# Altium project Charger-Board-v1.1.PrjPcb (part 1 of 3)
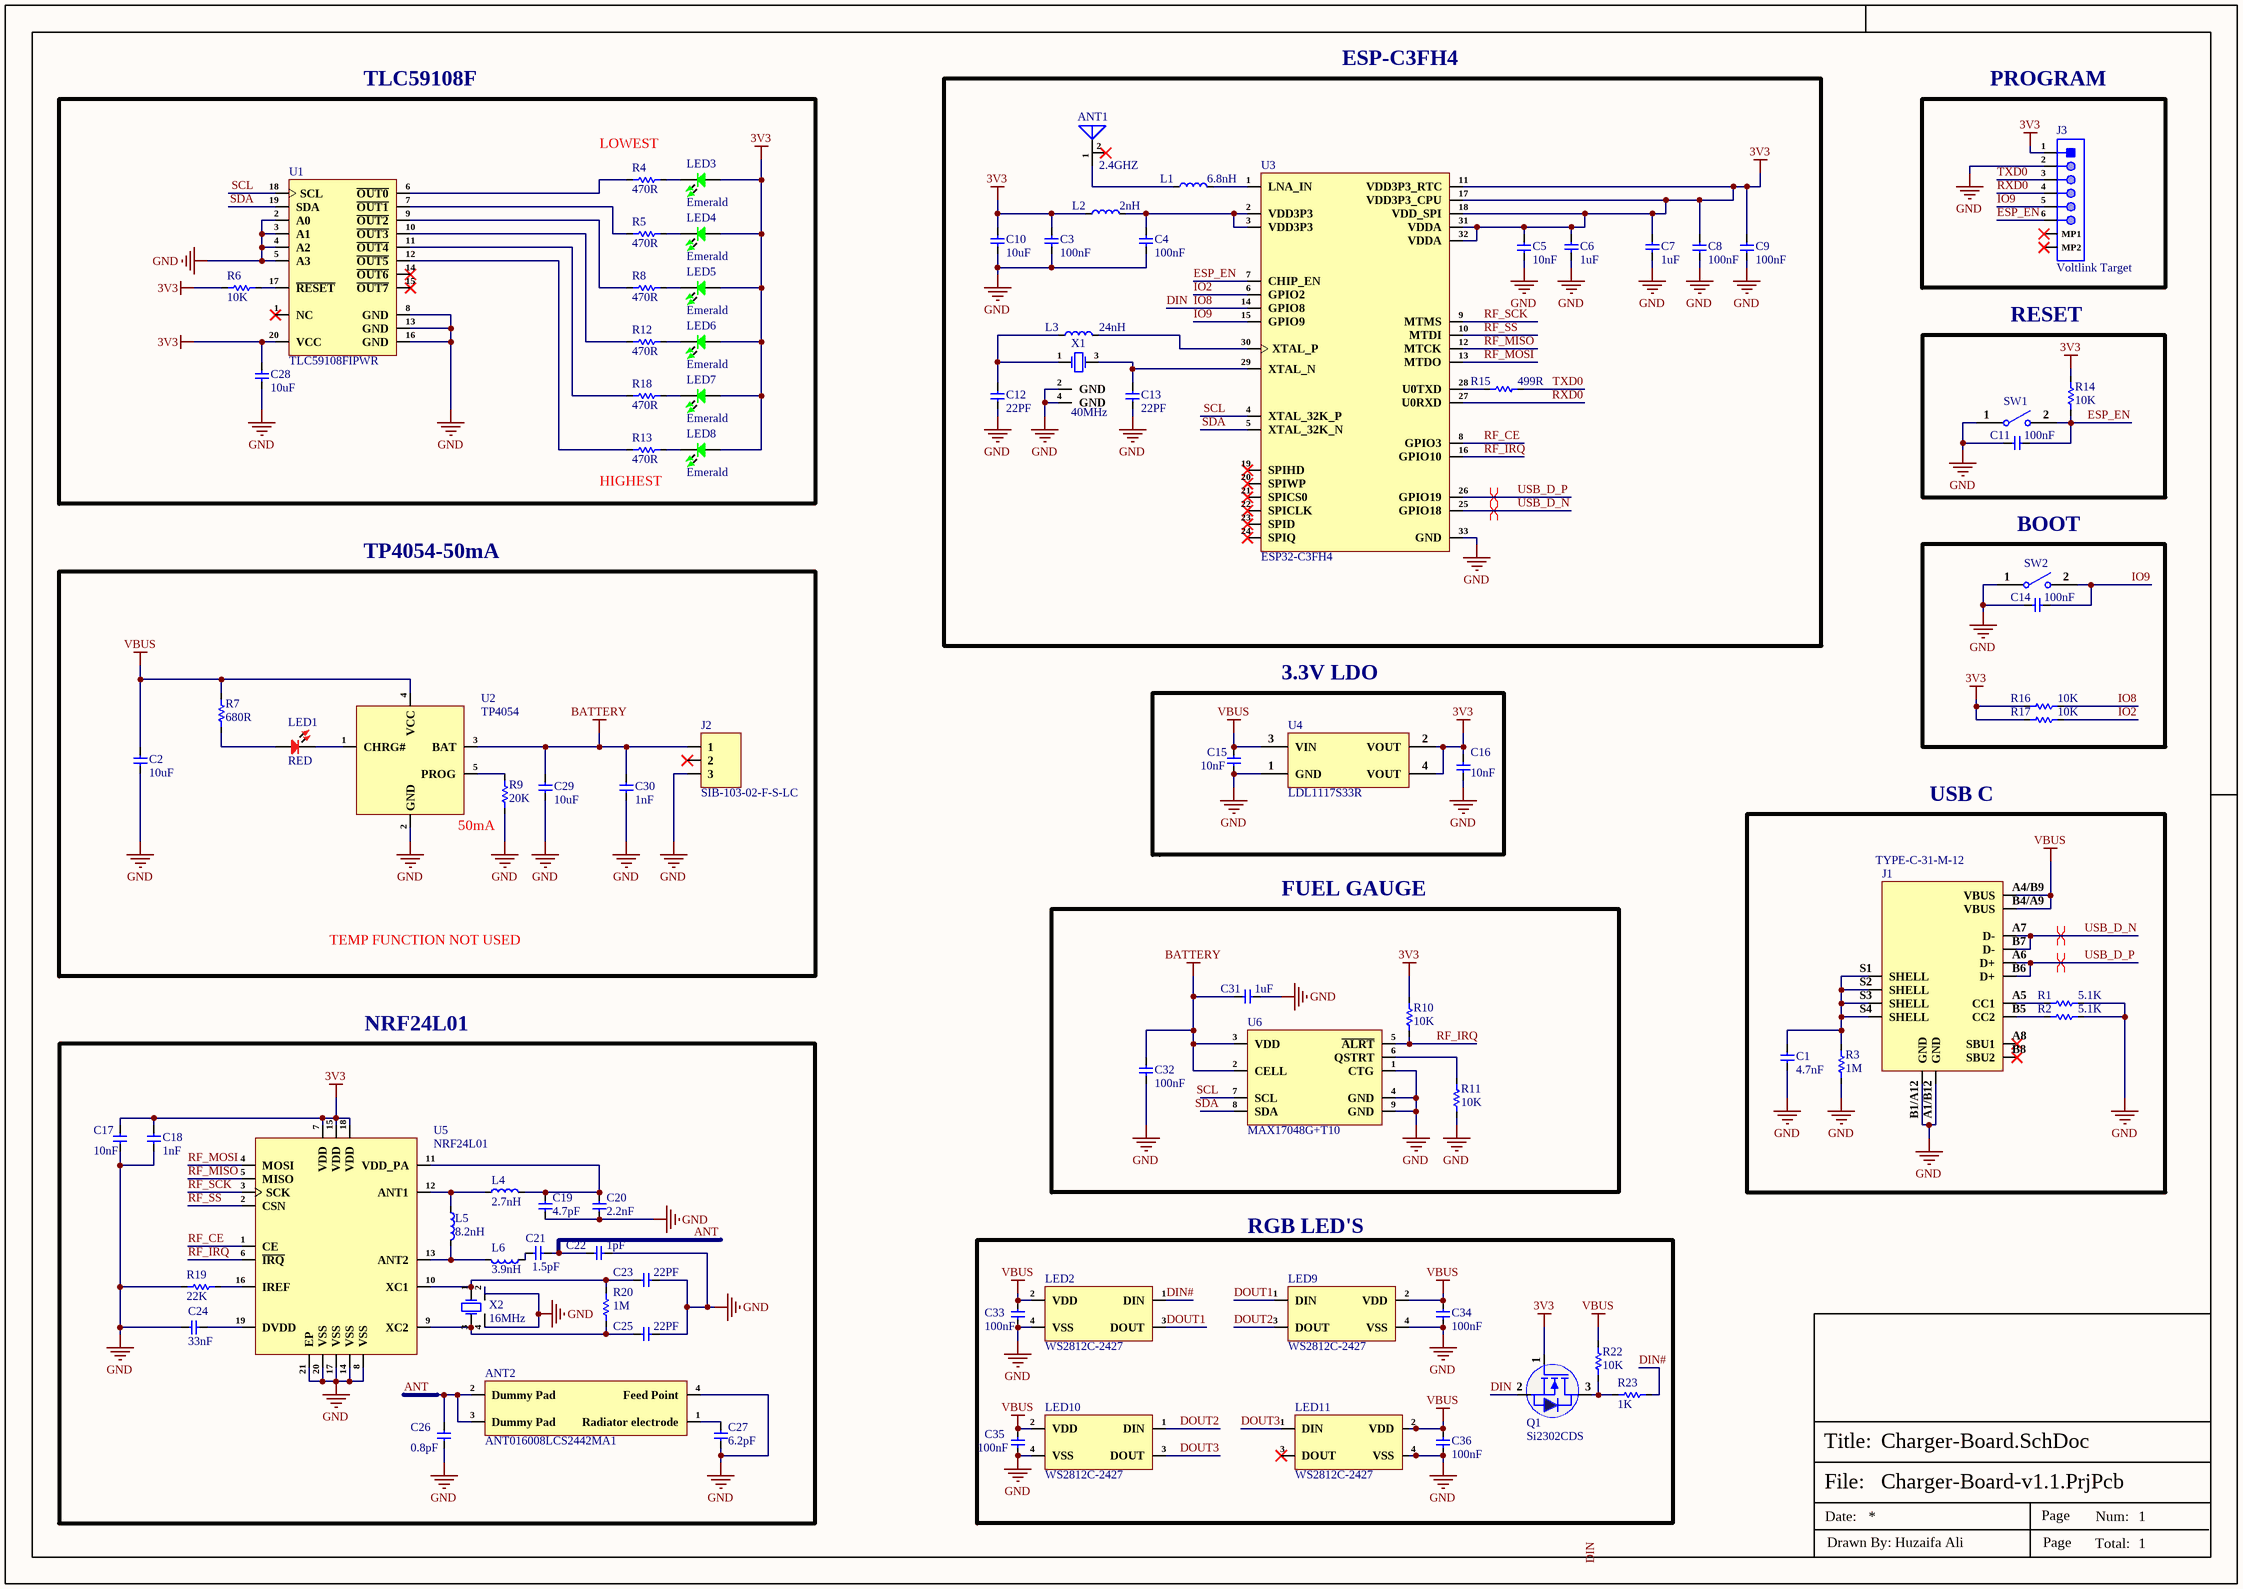
[diagram p0: Charger-Board.SchDoc]
1 sheet, 91 parts. Net scope: global (net labels, ports and power ports of the same name join across sheets).
Board file: Charger-v1.1.PcbDoc

## Sheet Charger-Board.SchDoc
size 420 x 297 mm; SheetNumber: 1; SheetTotal: 1

### Parts
ANT1  2.4GHZ  [RFANT3216120A5T]
ANT2  ANT016008LCS2442MA1  [ANT016008LCS2442MA1]
C1  4.7nF  [Cap-1206]
C2  10uF  [Cap-0603]
C3  100nF  [Cap-0402]
C4  100nF  [Cap-0402]
C5  10nF  [Cap-0402]
C6  1uF  [Cap-0402]
C7  1uF  [Cap-0402]
C8  100nF  [Cap-0402]
C9  100nF  [Cap-0402]
C10  10uF  [Cap-0402]
C11  100nF  [Cap-0402]
C12  22PF  [Cap-0402]
C13  22PF  [Cap-0402]
C14  100nF  [Cap-0402]
C15  10nF  [Cap-0402]
C16  10nF  [Cap-0402]
C17  10nF  [Cap-0402]
C18  1nF  [Cap-0402]
C19  4.7pF  [Cap-0402]
C20  2.2nF  [Cap-0402]
C21  1.5pF  [Cap-0402]
C22  1pF  [Cap-0402]
C23  22PF  [Cap-0402]
C24  33nF  [CAP-0201]
C25  22PF  [Cap-0402]
C26  0.8pF  [CAP-0201]
C27  6.2pF  [CAP-0201]
C28  10uF  [Cap-0603]
C29  10uF  [Cap-0603]
C30  1nF  [Cap-0402]
C31  1uF  [Cap-0402]
C32  100nF  [Cap-0402]
C33  100nF  [Cap-0402]
C34  100nF  [Cap-0402]
C35  100nF  [Cap-0402]
C36  100nF  [Cap-0402]
J1  TYPE-C-31-M-12  [TYPE-C-31-M-12_]
J2  SIB-103-02-F-S-LC  [SIB-103-02-F-S-LC]
J3  Voltlink Target  [Voltlink Target]
L1  6.8nH  [IND-0201]
L2  2nH  [IND-0201]
L3  24nH  [IND-0201]
L4  2.7nH  [IND-0402]
L5  8.2nH  [IND-0402]
L6  3.9nH  [IND-0402]
LED1  RED  [LED-0603]
LED2  WS2812C-2427  [WS2812C-2427]
LED3  Emerald  [LED-0603]
LED4  Emerald  [LED-0603]
LED5  Emerald  [LED-0603]
LED6  Emerald  [LED-0603]
LED7  Emerald  [LED-0603]
LED8  Emerald  [LED-0603]
LED9  WS2812C-2427  [WS2812C-2427]
LED10  WS2812C-2427  [WS2812C-2427]
LED11  WS2812C-2427  [WS2812C-2427]
Q1  Si2302CDS  [Sot-23]
R1  5.1K  [Res-0402]
R2  5.1K  [Res-0402]
R3  1M  [Res-0603]
R4  470R  [Res-0402]
R5  470R  [Res-0402]
R6  10K  [Res-0402]
R7  680R  [Res-0402]
R8  470R  [Res-0402]
R9  20K  [Res-0402]
R10  10K  [Res-0402]
R11  10K  [Res-0402]
R12  470R  [Res-0402]
R13  470R  [Res-0402]
R14  10K  [Res-0402]
R15  499R  [Res-0402]
R16  10K  [Res-0402]
R17  10K  [Res-0402]
R18  470R  [Res-0402]
R19  22K  [Res-0603]
R20  1M  [Res-0402]
R22  10K  [Res-0402]
R23  1K  [Res-0402]
SW1  B3U-1000P  [B3U-1000P]  (value not drawn)
SW2  B3U-1000P  [B3U-1000P]  (value not drawn)
U1  TLC59108FIPWR  [TSSOP-20]
U2  TP4054  [SOT-23-5]
U3  ESP32-C3FH4  [32-QFN (5x5)]
U4  LDL1117S33R  [SOT- 223]
U5  NRF24L01  [20-QFN (4x4) EP Via]
U6  MAX17048G+T10  [8-TDFN-EP (2x2)]
X1  40MHz  [X322540MPB4SI_]
X2  16MHz  [SMD3225-4P]

### Blocks framed on the sheet
TLC59108F: C28 LED3-LED8 R4-R6 R8 R12 R13 R18 U1
ESP-C3FH4: ANT1 C3-C10 C12 C13 L1-L3 R15 U3 X1
PROGRAM: J3
RESET: C11 R14 SW1
TP4054-50mA: C2 C29 C30 J2 LED1 R7 R9 U2
BOOT: C14 R16 R17 SW2
USB C: C1 J1 R1-R3
FUEL GAUGE: C31 C32 R10 R11 U6
RGB LED'S: C33-C36 LED2 LED9-LED11 Q1 R22 R23

### Nets
3V3: C3.2 C5.2 C6.1 C7.1 C8.2 C9.2 C10.2 C16.2 C17.2 C18.2 C28.2 J3.1 L2.1 LED3.1 LED4.1 LED5.1 LED6.1 LED7.1 LED8.1 Q1.1(G) R6.1 R10.1 R14.1 R16.1 R17.1 U1.20(VCC) U3.11(VDD3P3_RTC) U3.17(VDD3P3_CPU) U3.18(VDD_SPI) U3.31(VDDA) U3.32(VDDA) U4.2(VOUT) U4.4(VOUT) U5.7(VDD) U5.15(VDD) U5.18(VDD)
BATTERY: C29.2 C30.2 C31.2 C32.1 J2.1 U2.3(BAT) U6.2(CELL) U6.3(VDD)
GND: ANT2.4(Feed_Point) C1.1 C2.1 C3.1 C4.1 C5.1 C6.2 C7.2 C8.1 C9.1 C10.1 C11.2 C12.1 C13.1 C14.2 C15.1 C16.1 C17.1 C18.1 C19.1 C20.1 C22.2 C23.2 C24.1 C25.2 C26.1 C27.1 C28.1 C29.1 C30.1 C31.1 C32.2 C33.1 C34.1 C35.1 C36.1 J1.A1/B12(GND) J1.B1/A12(GND) J2.3 J3.2 LED2.4(VSS) LED9.4(VSS) LED10.4(VSS) LED11.4(VSS) R1.2 R2.2 R3.1 R9.1 R11.1 R19.1 SW1.1 SW2.1 U1.2(A0) U1.3(A1) U1.4(A2) U1.5(A3) U1.8(GND) U1.13(GND) U1.16(GND) U2.2(GND) U3.33(GND) U4.1(GND) U5.8(VSS) U5.14(VSS) U5.17(VSS) U5.20(VSS) U5.21(EP) U6.1(CTG) U6.4(GND) U6.9(GND) X1.2(GND) X1.4(GND) X2.2(GND) X2.4(GND)
VBUS: C2.2 C15.2 C33.2 C34.2 C35.2 C36.2 J1.A4/B9(VBUS) J1.B4/A9(VBUS) LED2.2(VDD) LED9.2(VDD) LED10.2(VDD) LED11.2(VDD) R7.2 R22.2 U2.4(VCC) U4.3(VIN)
ANT: ANT2.2(Dummy_Pad) ANT2.3(Dummy_Pad) C21.2 C22.1 C26.2
DIN: Q1.2(S) R16.2 U3.14(GPIO8)  [also labelled IO8]
DIN#: LED2.1(DIN) R23.2
DOUT1: LED2.3(DOUT) LED9.1(DIN)
DOUT2: LED9.3(DOUT) LED10.1(DIN)
DOUT3: LED10.3(DOUT) LED11.1(DIN)
ESP_EN: C11.1 J3.6 R14.2 SW1.2 U3.7(CHIP_EN)
IO2: R17.2 U3.6(GPIO2)
IO9: C14.1 J3.5 SW2.2 U3.15(GPIO9)
RF_CE: U3.8(GPIO3) U5.1(CE)
RF_IRQ: R10.2 U3.16(GPIO10) U5.6(~{IRQ}) U6.5(~{ALRT})
RF_MISO: U3.12(MTCK) U5.5(MISO)
RF_MOSI: U3.13(MTDO) U5.4(MOSI)
RF_SCK: U3.9(MTMS) U5.3(SCK)
RF_SS: U3.10(MTDI) U5.2(CSN)
RXD0: J3.4 U3.27(U0RXD)
SCL: U1.18(SCL) U3.4(XTAL_32K_P) U6.7(SCL)
SDA: U1.19(SDA) U3.5(XTAL_32K_N) U6.8(SDA)
TXD0: J3.3 R15.2
USB_D_N: J1.A7(D-) J1.B7(D-) U3.25(GPIO18)
USB_D_P: J1.A6(D+) J1.B6(D+) U3.26(GPIO19)
NetANT1_1: ANT1.1(A) L1.1
NetANT2_1: ANT2.1(Radiator_electrode) C27.2
NetC1_2: C1.2 J1.S1(SHELL) J1.S2(SHELL) J1.S3(SHELL) J1.S4(SHELL) R3.2
NetC4_2: C4.2 L2.2 U3.2(VDD3P3) U3.3(VDD3P3)
NetC12_2: C12.2 L3.1 X1.1(CRYSTAL)
NetC13_2: C13.2 U3.29(XTAL_N) X1.3(CRYSTAL)
NetC19_2: C19.2 C20.2 L4.2 U5.11(VDD_PA)
NetC21_1: C21.1 L6.2
NetC23_1: C23.1 R20.2 U5.10(XC1) X2.1(OSC1)
NetC24_2: C24.2 U5.19(DVDD)
NetC25_1: C25.1 R20.1 U5.9(XC2) X2.3(OSC2)
NetJ1_A5: J1.A5(CC1) R1.1
NetJ1_B5: J1.B5(CC2) R2.1
NetL1_2: L1.2 U3.1(LNA_IN)
NetL3_2: L3.2 U3.30(XTAL_P)
NetL4_1: L4.1 L5.2 U5.12(ANT1)
NetL5_1: L5.1 L6.1 U5.13(ANT2)
NetLED1_1: LED1.1 R7.1
NetLED1_2: LED1.2 U2.1(CHRG#)
NetLED3_2: LED3.2 R4.2
NetLED4_2: LED4.2 R5.2
NetLED5_2: LED5.2 R8.2
NetLED6_2: LED6.2 R12.2
NetLED7_2: LED7.2 R18.2
NetLED8_2: LED8.2 R13.2
NetQ1_3: Q1.3(D) R22.1 R23.1
NetR4_1: R4.1 U1.6(~{OUT0})
NetR5_1: R5.1 U1.7(~{OUT1})
NetR6_2: R6.2 U1.17(~{RESET})
NetR8_1: R8.1 U1.9(~{OUT2})
NetR9_2: R9.2 U2.5(PROG)
NetR11_2: R11.2 U6.6(QSTRT)
NetR12_1: R12.1 U1.10(~{OUT3})
NetR13_1: R13.1 U1.12(~{OUT5})
NetR15_1: R15.1 U3.28(U0TXD)
NetR18_1: R18.1 U1.11(~{OUT4})
NetR19_2: R19.2 U5.16(IREF)

Not connected (* = marked no-connect by the designer): ANT1 2(NC)*; J1 A8(SBU1)* B8(SBU2)*; J2 2*; J3 MP1* MP2*; LED11 3(DOUT)*; U1 1(NC)* 14(~{OUT6})* 15(~{OUT7})*; U3 19(SPIHD)* 20(SPIWP)* 21(SPICS0)* 22(SPICLK)* 23(SPID)* 24(SPIQ)*

### Layout directives
differential pair; net class USB_PROGRAM; differential pair class USB_PROGRAM_LINES; rule Impedance Constraint [Min = 85.00    Max = 90.00    ]; rule Matched Net Lengths [Tolerance = 50mil]: USB_D_N, USB_D_P

### Notes on the sheet
- (near R4) LOWEST
- (near R13) HIGHEST
- 3.3V LDO
- (near U2) 50mA
- TEMP FUNCTION NOT USED
- NRF24L01
- Labels drawn without touching a wire or pin: DIN
- File:
- Title:
- Date:
- Page
- Num:
- Total:
- Drawn By: Huzaifa Ali